# Altium schematic sheet PowerPanel_1_Mains_24V_48V.SchDoc
size 594 x 420 mm; SheetNumber: 2; SheetTotal: 6
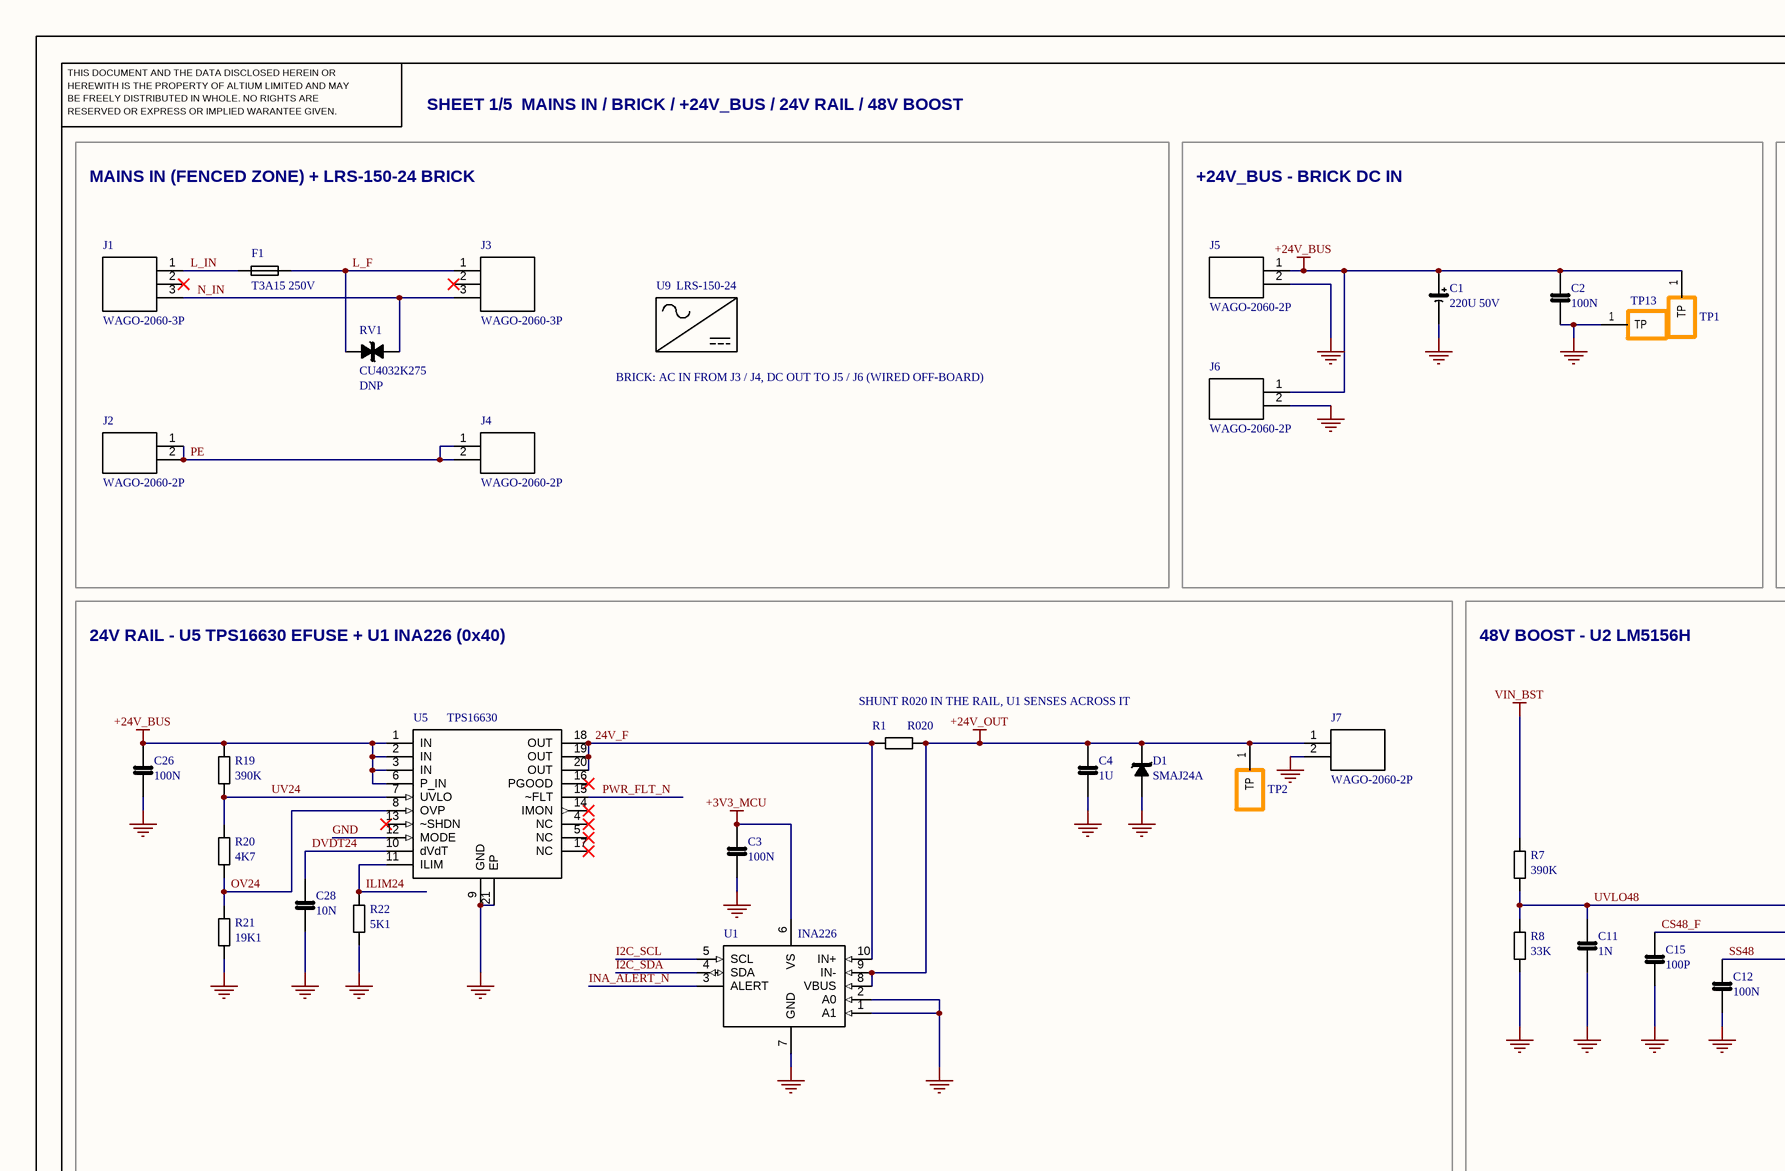
[diagram p0: PowerPanel_1_Mains_24V_48V.SchDoc, top left]
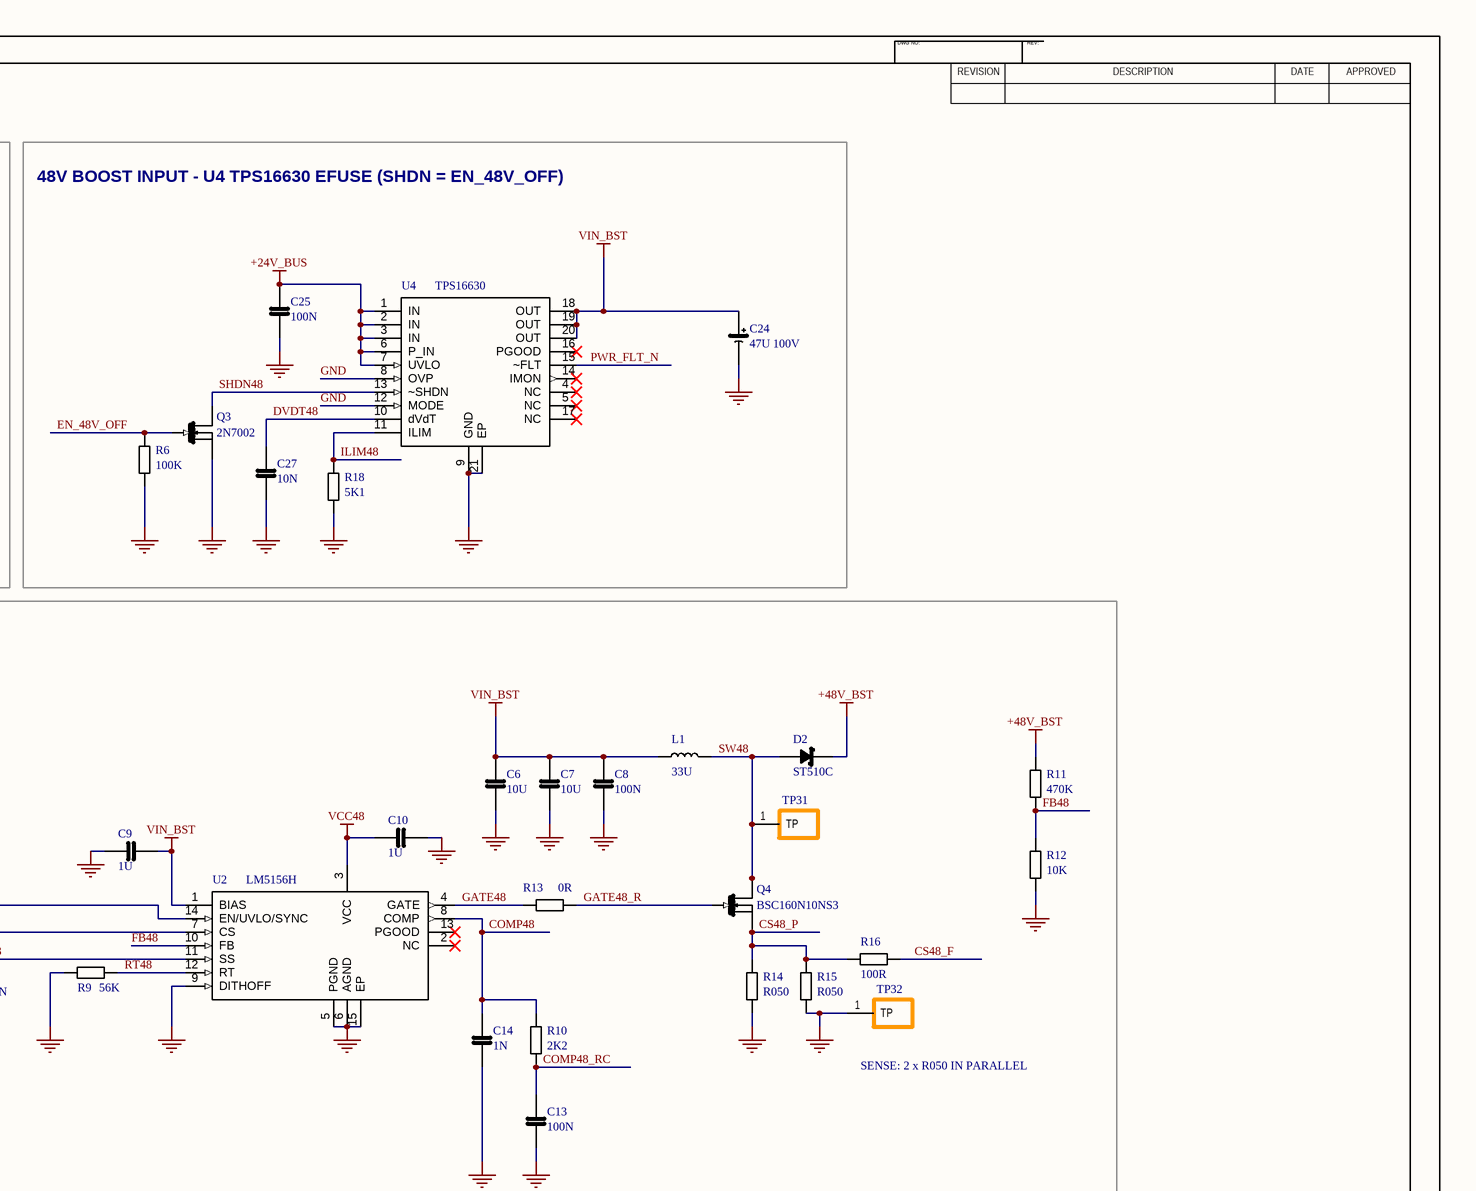
[diagram p1: PowerPanel_1_Mains_24V_48V.SchDoc, top right]
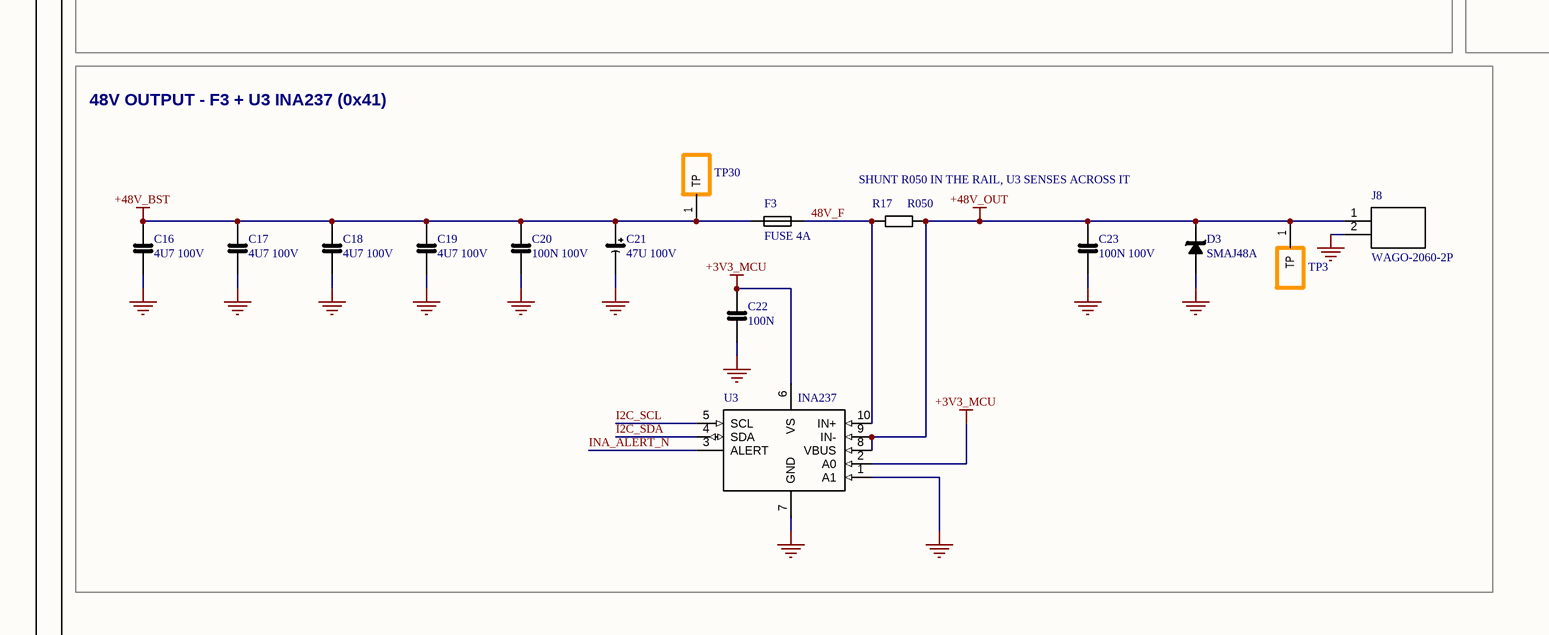
[diagram p2: PowerPanel_1_Mains_24V_48V.SchDoc, bottom left]
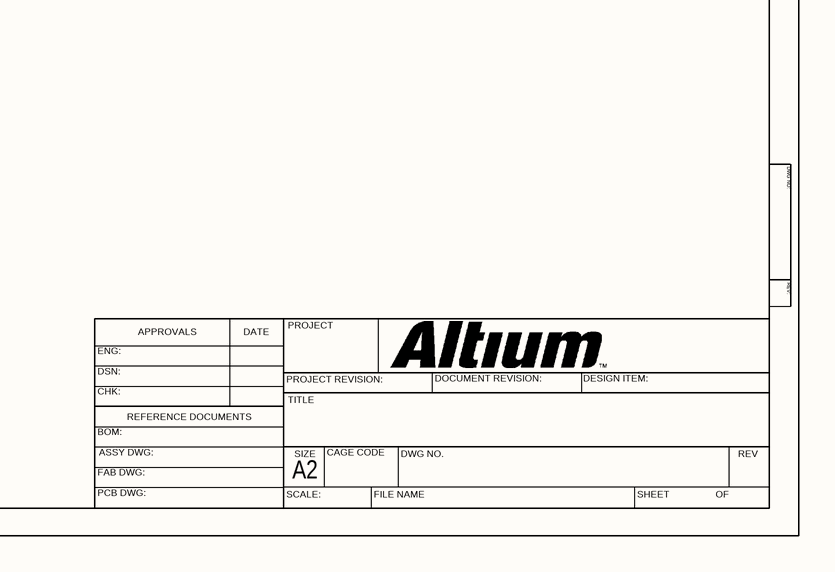
[diagram p3: PowerPanel_1_Mains_24V_48V.SchDoc, bottom right]

## Parts
C1  220U 50V  [CAPAE_D10X10.5]
C2  100N  [CAP0603]
C3  100N  [CAP0603]
C4  1U  [CAP0805]
C6  10U  [CAP1206]
C7  10U  [CAP1206]
C8  100N  [CAP0603]
C9  1U  [CAP0805]
C10  1U  [CAP0603]
C11  1N  [CAP0603]
C12  100N  [CAP0603]
C13  100N  [CAP0603]
C14  1N  [CAP0603]
C15  100P  [CAP0603]
C16  4U7 100V  [CAP1210]
C17  4U7 100V  [CAP1210]
C18  4U7 100V  [CAP1210]
C19  4U7 100V  [CAP1210]
C20  100N 100V  [CAP0603]
C21  47U 100V  [CAPAE_D8X10.5]
C22  100N  [CAP0603]
C23  100N 100V  [CAP0603]
C24  47U 100V  [CAPAE_D8X10.5]
C25  100N  [CAP0603]
C26  100N  [CAP0603]
C27  10N  [CAP0603]
C28  10N  [CAP0603]
D1  SMAJ24A  [SMA]
D2  ST510C  [SMC]
D3  SMAJ48A  [SMA]
F1  T3A15 250V  [FUSE_SCT1032]
F3  FUSE 4A  [FUSE1206]
J1  WAGO-2060-3P  [TERM_WAGO_2060-453]
J2  WAGO-2060-2P  [TERM_WAGO_2060-452]
J3  WAGO-2060-3P  [TERM_WAGO_2060-453]
J4  WAGO-2060-2P  [TERM_WAGO_2060-452]
J5  WAGO-2060-2P  [TERM_WAGO_2060-452]
J6  WAGO-2060-2P  [TERM_WAGO_2060-452]
J7  WAGO-2060-2P  [TERM_WAGO_2060-452]
J8  WAGO-2060-2P  [TERM_WAGO_2060-452]
L1  33U  [IND_MWSA1206S]
Q3  2N7002  [SOT-23-3]
Q4  BSC160N10NS3  [TDSON-8_5X6_EP]
R1  R020  [R1206]
R6  100K  [R0603]
R7  390K  [R0603]
R8  33K  [R0603]
R9  56K  [R0603]
R10  2K2  [R0603]
R11  470K  [R0603]
R12  10K  [R0603]
R13  0R  [R0603]
R14  R050  [R1206]
R15  R050  [R1206]
R16  100R  [R0603]
R17  R050  [R1206]
R18  5K1  [R0603]
R19  390K  [R0603]
R20  4K7  [R0603]
R21  19K1  [R0603]
R22  5K1  [R0603]
RV1  CU4032K275  [VAR_CU4032]
TP1  TP  [TESTPOINT]  (value not drawn)
TP2  TP  [TESTPOINT]  (value not drawn)
TP3  TP  [TESTPOINT]  (value not drawn)
TP13  TP  [TESTPOINT]  (value not drawn)
TP30  TP  [TESTPOINT]  (value not drawn)
TP31  TP  [TESTPOINT]  (value not drawn)
TP32  TP  [TESTPOINT]  (value not drawn)
U1  INA226  [MSOP-10]
U2  LM5156H  [HTSSOP-14_5X4.4_EP]
U3  INA237  [MSOP-10]
U4  TPS16630  [HTSSOP-20_6.5X4.4_EP]
U5  TPS16630  [HTSSOP-20_6.5X4.4_EP]
U9  LRS-150-24  [PSU_MW-LRS-150_CASE241A]

## Blocks framed on the sheet
MAINS IN (FENCED ZONE) + LRS-150-24 BRICK: F1 J1-J4 RV1 U9
+24V_BUS - BRICK DC IN: C1 C2 J5 J6 TP1 TP13
48V BOOST INPUT - U4 TPS16630 EFUSE (SHDN = EN_48V_OFF): C24 C25 C27 Q3 R6 R18 U4
24V RAIL - U5 TPS16630 EFUSE + U1 INA226 (0x40): C3 C4 C26 C28 D1 J7 R1 R19-R22 TP2 U1 U5
48V BOOST - U2 LM5156H: C6-C15 D2 L1 Q4 R7-R16 TP31 TP32 U2
48V OUTPUT - F3 + U3 INA237 (0x41): C16-C23 D3 F3 J8 R17 TP3 TP30 U3

## Nets
+3V3_MCU: C3.1 C22.1 U1.6(VS) U3.2(A0) U3.6(VS)
+24V_BUS: C1.1(+) C2.1 C25.1 C26.1 J5.1 J6.1 R19.1 TP1.1(TP) U4.1(IN) U4.2(IN) U4.3(IN) U4.6(P_IN) U4.7(UVLO) U5.1(IN) U5.2(IN) U5.3(IN) U5.6(P_IN)
+24V_OUT: C4.1 D1.1(K) J7.1 R1.2 TP2.1(TP) U1.8(VBUS) U1.9(IN-)
+48V_BST: C16.1 C17.1 C18.1 C19.1 C20.1 C21.1(+) D2.1(K) F3.1 R11.1 TP30.1(TP)
+48V_OUT: C23.1 D3.1(K) J8.1 R17.2 TP3.1(TP) U3.8(VBUS) U3.9(IN-)
GND: C1.2(-) C2.2 C3.2 C4.2 C6.2 C7.2 C8.2 C9.2 C10.2 C11.2 C12.2 C13.2 C14.2 C15.2 C16.2 C17.2 C18.2 C19.2 C20.2 C21.2(-) C22.2 C23.2 C24.2(-) C25.2 C26.2 C27.2 C28.2 D1.2(A) D3.2(A) J5.2 J6.2 J7.2 J8.2 Q3.2(S) R6.2 R8.2 R9.2 R12.2 R14.2 R15.2 R18.2 R21.2 R22.2 TP13.1(TP) TP32.1(TP) U1.1(A1) U1.2(A0) U1.7(GND) U2.5(PGND) U2.6(AGND) U2.9(DITHOFF) U2.15(EP) U3.1(A1) U3.7(GND) U4.8(OVP) U4.9(GND) U4.12(MODE) U4.21(EP) U5.9(GND) U5.12(MODE) U5.21(EP)
VCC48: C10.1 U2.3(VCC)
VIN_BST: C6.1 C7.1 C8.1 C9.1 C24.1(+) L1.1 R7.1 U2.1(BIAS) U4.18(OUT) U4.19(OUT) U4.20(OUT)
24V_F: R1.1 U1.10(IN+) U5.18(OUT) U5.19(OUT) U5.20(OUT)
48V_F: F3.2 R17.1 U3.10(IN+)
COMP48: C14.1 R10.1 U2.8(COMP)
COMP48_RC: C13.1 R10.2
CS48_F: C15.1 R16.2 U2.7(CS)
CS48_P: Q4.1(S) Q4.2(S) Q4.3(S) R14.1 R15.1 R16.1
DVDT24: C28.1 U5.10(dVdT)
DVDT48: C27.1 U4.10(dVdT)
EN_48V_OFF: Q3.1(G) R6.1
FB48: R11.2 R12.1 U2.10(FB)
GATE48: R13.1 U2.4(GATE)
GATE48_R: Q4.4(G) R13.2
I2C_SCL: U1.5(SCL) U3.5(SCL)
I2C_SDA: U1.4(SDA) U3.4(SDA)
ILIM24: R22.1 U5.11(ILIM)
ILIM48: R18.1 U4.11(ILIM)
INA_ALERT_N: U1.3(ALERT) U3.3(ALERT)
L_F: F1.2 J3.1 RV1.1
L_IN: F1.1 J1.1
N_IN: J1.3 J3.3 RV1.2
OV24: R20.2 R21.1 U5.8(OVP)
PE: J2.1 J2.2 J4.1 J4.2
PWR_FLT_N: U4.15(~FLT) U5.15(~FLT)
RT48: R9.1 U2.12(RT)
SHDN48: Q3.3(D) U4.13(~SHDN)
SS48: C12.1 U2.11(SS)
SW48: D2.2(A) L1.2 Q4.5(D) Q4.6(D) Q4.7(D) Q4.8(D) Q4.9(D) TP31.1(TP)
UV24: R19.2 R20.1 U5.7(UVLO)
UVLO48: C11.1 R7.2 R8.1 U2.14(EN/UVLO/SYNC)

Not connected (* = marked no-connect by the designer): J1 2*; J3 2*; U2 2(NC)* 13(PGOOD)*; U4 4(NC)* 5(NC)* 14(IMON)* 16(PGOOD)* 17(NC)*; U5 4(NC)* 5(NC)* 13(~SHDN)* 14(IMON)* 16(PGOOD)* 17(NC)*

## Notes on the sheet
- DWG NO:
- REV:
- THIS DOCUMENT AND THE DATA DISCLOSED HEREIN OR
- HEREWITH IS THE PROPERTY OF ALTIUM LIMITED AND MAY
- BE FREELY DISTRIBUTED IN WHOLE. NO RIGHTS ARE
- RESERVED OR EXPRESS OR IMPLIED WARANTEE GIVEN.
- SHEET 1/5  MAINS IN / BRICK / +24V_BUS / 24V RAIL / 48V BOOST
- REVISION
- DESCRIPTION
- DATE
- APPROVED
- (near U9) BRICK: AC IN FROM J3 / J4, DC OUT TO J5 / J6 (WIRED OFF-BOARD)
- (near R1) SHUNT R020 IN THE RAIL, U1 SENSES ACROSS IT
- (near TP32) SENSE: 2 x R050 IN PARALLEL
- (near R17) SHUNT R050 IN THE RAIL, U3 SENSES ACROSS IT
- ENG:
- APPROVALS
- PROJECT
- DSN:
- CHK:
- REFERENCE DOCUMENTS
- PROJECT REVISION:
- TITLE
- DOCUMENT REVISION:
- DESIGN ITEM:
- BOM:
- FAB DWG:
- PCB DWG:
- ASSY DWG:
- SCALE:
- A2
- SIZE
- CAGE CODE
- FILE NAME
- DWG NO.
- SHEET
- OF
- REV

## Library data of the parts
C1 = CP_220U_50V_10X10: CAP ALU // 220U // 50V // 20% // 105C // SMD D10X10.5; MFR: jieerrui; MPN: JVJ50V220M10x10; Value: 220U; LCSC: C46550417; JLC_TYPE: EXTENDED; JLC_CHECKED: 2026-10-03 STOCK 197742; Datasheet: https://www.lcsc.com/datasheet/lcsc_datasheet_2504101957_jieerrui-JVJ16V470M6x8_C46550400.pdf
C2 C3 C8 C12 C13 C22 C25 C26 = C_100N_0603: CAP // 100N // 50V // X7R // 0603; MFR: YAGEO; MPN: CC0603KRX7R9BB104; Value: 100N; LCSC: C14663; JLC_TYPE: BASIC; JLC_CHECKED: 2026-09-29 STOCK 55887132; Datasheet: https://www.lcsc.com/datasheet/lcsc_datasheet_2211101700_YAGEO-CC0603KRX7R9BB104_C14663.pdf
C4 C9 = C_1U_0805: CAP // 1U // 50V // X7R // 0805; MFR: Samsung Electro-Mechanics; MPN: CL21B105KBFNNNE; Value: 1U; LCSC: C28323; JLC_TYPE: BASIC; JLC_CHECKED: 2026-09-29 STOCK 2359989; Datasheet: https://www.lcsc.com/datasheet/lcsc_datasheet_2304140030_Samsung-Electro-Mechanics-CL21B105KBFNNNE_C28323.pdf
C6 C7 = C_10U_1206: CAP // 10U // 50V // X5R // 1206; MFR: Samsung Electro-Mechanics; MPN: CL31A106KBHNNNE; Value: 10U; LCSC: C13585; JLC_TYPE: BASIC; JLC_CHECKED: 2026-09-29 STOCK 2442079; Datasheet: https://www.lcsc.com/datasheet/lcsc_datasheet_2304140030_Samsung-Electro-Mechanics-CL31A106KBHNNNE_C13585.pdf
C10 = C_1U_0603: CAP // 1U // 50V // X5R // 0603; MFR: Samsung Electro-Mechanics; MPN: CL10A105KB8NNNC; Value: 1U; LCSC: C15849; JLC_TYPE: BASIC; JLC_CHECKED: 2026-09-29 STOCK 6435528; Datasheet: https://www.lcsc.com/datasheet/lcsc_datasheet_2304140030_Samsung-Electro-Mechanics-CL10A105KB8NNNC_C15849.pdf
C11 C14 = C_1N_0603: CAP // 1N // 50V // X7R // 0603; MFR: Samsung Electro-Mechanics; MPN: CL10B102KB8NNNC; Value: 1N; LCSC: C1588; JLC_TYPE: BASIC; JLC_CHECKED: 2026-09-29 STOCK 7937326; Datasheet: https://www.lcsc.com/datasheet/lcsc_datasheet_2304140030_Samsung-Electro-Mechanics-CL10B102KB8NNNC_C1588.pdf
C15 = C_100P_0603: CAP // 100P // 50V // C0G // 0603; MFR: Samsung Electro-Mechanics; MPN: CL10C101JB8NNNC; Value: 100P; LCSC: C14858; JLC_TYPE: BASIC; JLC_CHECKED: 2026-09-29 STOCK 4024635; Datasheet: https://www.lcsc.com/datasheet/lcsc_datasheet_2304140030_Samsung-Electro-Mechanics-CL10C101JB8NNNC_C14858.pdf
C16-C19 = C_4U7_100V_1210: CAP // 4U7 // 100V // X7R // 1210; MFR: PSA(Prosperity Dielectrics); MPN: FS32X475K101EGG; Value: 4U7; LCSC: C381466; JLC_TYPE: EXTENDED; JLC_CHECKED: 2026-10-03 STOCK 171506; Datasheet: https://wmsc.lcsc.com/wmsc/upload/file/pdf/v2/lcsc/2304140030_PSA-Prosperity-Dielectrics-FS32X475K101EGG_C381466.pdf
C20 C23 = C_100N_100V_0603: CAP // 100N // 100V // X7R // 0603; MFR: Samsung Electro-Mechanics; MPN: CL10B104KC8NNNC; Value: 100N; LCSC: C15725; JLC_TYPE: EXTENDED; JLC_CHECKED: 2026-10-03 STOCK 692214; Datasheet: https://www.lcsc.com/datasheet/lcsc_datasheet_2304140030_Samsung-Electro-Mechanics-CL10B104KC8NNNC_C15725.pdf
C21 C24 = CP_47U_100V_8X10: CAP ALU // 47U // 100V // 20% // 105C // SMD D8X10.5; MFR: jieerrui; MPN: RV100V47M8X10; Value: 47U; LCSC: C48935391; JLC_TYPE: EXTENDED; JLC_CHECKED: 2026-10-03 STOCK 115676; Datasheet: https://www.lcsc.com/datasheet/lcsc_datasheet_2505151725_jieerrui-RV100V47M8X10_C48935391.pdf
C27 C28 = C_10N_0603: CAP // 10N // 50V // X7R // 0603; MFR: FH (Guangdong Fenghua Advanced Tech); MPN: 0603B103K500NT; Value: 10N; LCSC: C57112; JLC_TYPE: BASIC; JLC_CHECKED: 2026-09-29 STOCK 6903861; Datasheet: https://www.lcsc.com/datasheet/lcsc_datasheet_2304140030_FH--Guangdong-Fenghua-Advanced-Tech-0603B103K500NT_C57112.pdf
D1 = D_SMAJ24A: TVS // 24V UNI // 400W // 38V9 CLAMP // SMA; MFR: hongjiacheng; Value: 24V; MPN: SMAJ24A; LCSC: C19077541; JLC_TYPE: PREFERRED; JLC_CHECKED: 2026-09-29 STOCK 132041; Datasheet: https://wmsc.lcsc.com/wmsc/upload/file/pdf/v2/lcsc/2312280937_hongjiacheng-SMAJ24A_C19077541.pdf
D2 = D_ST510C: SCHOTTKY // 100V 5A // 600MV // 150A IFSM // SMC; MFR: MDD (Microdiode Semiconductor); Value: 100V 5A; MPN: ST510C; LCSC: C414013; JLC_TYPE: EXTENDED; JLC_CHECKED: 2026-10-03 STOCK 2060; Datasheet: https://www.lcsc.com/datasheet/lcsc_datasheet_2408090958_MDD-Microdiode-Semiconductor-ST510C_C414013.pdf
D3 = D_SMAJ48A: TVS // 48V UNI // 400W // 77V4 CLAMP // SMA; MFR: Littelfuse; Value: 48V; MPN: SMAJ48A; LCSC: C223991; JLC_TYPE: EXTENDED; JLC_CHECKED: 2026-10-03 STOCK 5668; Datasheet: https://www.lcsc.com/datasheet/lcsc_datasheet_2304140030_Littelfuse-SMAJ48A_C223991.pdf
F1 = F_T3A15_250V_1032: FUSE // T3.15A TIME-LAG // 250VAC // 100A BREAK // SMD 10.3X3.3; MFR: SETsafe / SETfuse; MPN: SCT1032T3.15A250V; Value: 3A15; LCSC: C19712564; JLC_TYPE: EXTENDED; JLC_CHECKED: 2026-10-03 STOCK 1944; Datasheet: https://wmsc.lcsc.com/wmsc/upload/file/pdf/v2/lcsc/2312181522_SETsafe--/--SETfuse-SCT1032T3-15A250V_C19712564.pdf
F3 = F_4A_63V_1206: FUSE // 4A // FAST // 63V // 50A BREAK // 1206; MFR: Shenzhen JDT Fuse; MPN: JFC1206-1400FS; Value: 4A; LCSC: C136349; JLC_TYPE: EXTENDED; JLC_CHECKED: 2026-10-03 STOCK 45560; Datasheet: https://www.lcsc.com/datasheet/lcsc_datasheet_2305151206_Shenzhen-JDT-Fuse-JFC1206-1400FS_C136349.pdf
J1 J3 = J_TERM-SPRING_3P_4.0_SMD: CONN // WAGO 2060 PUSH-IN // 3P // 4.0MM // 9A 320V // SMD; MPN: 2060-453/998-404; Value: 3P; MFR: WAGO; LCSC: C2765056; JLC_TYPE: EXTENDED; JLC_CHECKED: 2026-10-03 STOCK 1543; Datasheet: https://wmsc.lcsc.com/wmsc/upload/file/pdf/v2/lcsc/2106061734_WAGO-2060-453-998-404_C2765056.pdf
J2 J4-J8 = J_TERM-SPRING_2P_4.0_SMD: CONN // WAGO 2060 PUSH-IN // 2P // 4.0MM // 9A 320V // SMD; MPN: 2060-452/998-404; Value: 2P; MFR: WAGO; LCSC: C2765055; JLC_TYPE: EXTENDED; JLC_CHECKED: 2026-10-03 STOCK 27983; Datasheet: https://wmsc.lcsc.com/wmsc/upload/file/pdf/v2/lcsc/2410121253_WAGO-2060-452-998-404_C2765055.pdf
L1 = L_33U_1350: IND // 33U // ISAT 4.8A // IRMS 4.8A // 75MR // 1350 MOLDED; MFR: Sunlord; MPN: MWSA1206S-330MT; Value: 33U; LCSC: C408530; JLC_TYPE: EXTENDED; JLC_CHECKED: 2026-10-03 STOCK 2989; Datasheet: https://media.digikey.com/pdf/Data%20Sheets/Shenzhen%20Sunlord/MWSA-S_Series_DS.pdf
Q3 = Q_2N7002: NMOS // 60V // 115MA // 5R@10V // SOT-23; MFR: Jiangsu Changjing Electronics Technology Co., Ltd.; Value: 2N7002; MPN: 2N7002; LCSC: C8545; JLC_TYPE: BASIC; JLC_CHECKED: 2026-09-29 STOCK 1679919; Datasheet: https://www.lcsc.com/datasheet/lcsc_datasheet_2304140030_Jiangsu-Changjing-Electronics-Technology-Co---Ltd--2N7002_C8545.pdf
Q4 = Q_BSC160N10NS3G: NMOS // 100V // 42A // 16MR@10V // TDSON-8 5X6; MFR: Infineon Technologies; Value: BSC160N10NS3G; MPN: BSC160N10NS3 G; LCSC: C148261; JLC_TYPE: EXTENDED; JLC_CHECKED: 2026-10-03 STOCK 3614; Datasheet: https://www.lcsc.com/datasheet/lcsc_datasheet_2304140030_Infineon-Technologies-BSC160N10NS3G_C148261.pdf
R1 = R_R020_1206: SHUNT // R020 // 1% // 1W // 70PPM // 1206; MFR: PSA(Prosperity Dielectrics); MPN: FMF06FTHR020-LH; Value: R020; LCSC: C371097; JLC_TYPE: EXTENDED; JLC_CHECKED: 2026-10-03 STOCK 16724; Datasheet: https://www.lcsc.com/datasheet/lcsc_datasheet_2304140030_PSA-Prosperity-Dielectrics-FMF06FTHR020-LH_C371097.pdf
R6 = R_100K_0603: RES // 100K // 1% // 100MW // 0603; MFR: UNI-ROYAL(Uniroyal Elec); MPN: 0603WAF1003T5E; Value: 100K; LCSC: C25803; JLC_TYPE: BASIC; JLC_CHECKED: 2026-09-29 STOCK 22429301; Datasheet: https://www.lcsc.com/datasheet/lcsc_datasheet_2206010045_UNI-ROYAL-Uniroyal-Elec-0603WAF1003T5E_C25803.pdf
R7 R19 = R_390K_0603: RES // 390K // 1% // 100MW // 0603; MFR: UNI-ROYAL(Uniroyal Elec); MPN: 0603WAF3903T5E; Value: 390K; LCSC: C23150; JLC_TYPE: PREFERRED; JLC_CHECKED: 2026-10-03 STOCK 76545; Datasheet: https://www.lcsc.com/datasheet/lcsc_datasheet_2206010116_UNI-ROYAL-Uniroyal-Elec-0603WAF3903T5E_C23150.pdf
R8 = R_33K_0603: RES // 33K // 1% // 100MW // 0603; MFR: UNI-ROYAL(Uniroyal Elec); MPN: 0603WAF3302T5E; Value: 33K; LCSC: C4216; JLC_TYPE: BASIC; JLC_CHECKED: 2026-10-03 STOCK 3235651; Datasheet: https://www.lcsc.com/datasheet/lcsc_datasheet_2206010230_UNI-ROYAL-Uniroyal-Elec-0603WAF3302T5E_C4216.pdf
R9 = R_56K_0603: RES // 56K // 1% // 100MW // 0603; MFR: UNI-ROYAL(Uniroyal Elec); MPN: 0603WAF5602T5E; Value: 56K; LCSC: C23206; JLC_TYPE: BASIC; JLC_CHECKED: 2026-10-03 STOCK 1024608; Datasheet: https://www.lcsc.com/datasheet/lcsc_datasheet_2206010116_UNI-ROYAL-Uniroyal-Elec-0603WAF5602T5E_C23206.pdf
R10 = R_2K2_0603: RES // 2K2 // 1% // 100MW // 0603; MFR: UNI-ROYAL(Uniroyal Elec); MPN: 0603WAF2201T5E; Value: 2K2; LCSC: C4190; JLC_TYPE: BASIC; JLC_CHECKED: 2026-09-29 STOCK 7718232; Datasheet: https://www.lcsc.com/datasheet/lcsc_datasheet_2206010230_UNI-ROYAL-Uniroyal-Elec-0603WAF2201T5E_C4190.pdf
R11 = R_470K_0603: RES // 470K // 1% // 100MW // 0603; MFR: UNI-ROYAL(Uniroyal Elec); MPN: 0603WAF4703T5E; Value: 470K; LCSC: C23178; JLC_TYPE: BASIC; JLC_CHECKED: 2026-10-03 STOCK 1456053; Datasheet: https://www.lcsc.com/datasheet/lcsc_datasheet_2206010116_UNI-ROYAL-Uniroyal-Elec-0603WAF4703T5E_C23178.pdf
R12 = R_10K_0603: RES // 10K // 1% // 100MW // 0603; MFR: UNI-ROYAL(Uniroyal Elec); MPN: 0603WAF1002T5E; Value: 10K; LCSC: C25804; JLC_TYPE: BASIC; JLC_CHECKED: 2026-09-29 STOCK 21309815; Datasheet: https://www.lcsc.com/datasheet/lcsc_datasheet_2206010045_UNI-ROYAL-Uniroyal-Elec-0603WAF1002T5E_C25804.pdf
R13 = R_0R_0603: RES // 0R // JUMPER // 0603; MFR: UNI-ROYAL(Uniroyal Elec); MPN: 0603WAF0000T5E; Value: 0R; LCSC: C21189; JLC_TYPE: BASIC; JLC_CHECKED: 2026-09-29 STOCK 24079380; Datasheet: https://www.lcsc.com/datasheet/lcsc_datasheet_2411221126_UNI-ROYAL-Uniroyal-Elec-0603WAF0000T5E_C21189.pdf
R14 R15 R17 = R_R050_1206: SHUNT // R050 // 1% // 1W // 1206; MFR: Shenzhen Yezhan Elec.; MPN: YLRY06-1-50F; Value: R050; LCSC: C20608719; JLC_TYPE: EXTENDED; JLC_CHECKED: 2026-09-29 STOCK 79173; Datasheet: https://wmsc.lcsc.com/wmsc/upload/file/pdf/v2/lcsc/2401171159_Shenzhen-Yezhan-Elec--YLRY06-1-50F_C20608719.pdf
R16 = R_100R_0603: RES // 100R // 1% // 100MW // 0603; MFR: UNI-ROYAL(Uniroyal Elec); MPN: 0603WAF1000T5E; Value: 100R; LCSC: C22775; JLC_TYPE: BASIC; JLC_CHECKED: 2026-09-29 STOCK 11791812; Datasheet: https://www.lcsc.com/datasheet/lcsc_datasheet_2411221126_UNI-ROYAL-Uniroyal-Elec-0603WAF1000T5E_C22775.pdf
R18 R22 = R_5K1_0603: RES // 5K1 // 1% // 100MW // 0603; MFR: UNI-ROYAL(Uniroyal Elec); MPN: 0603WAF5101T5E; Value: 5K1; LCSC: C23186; JLC_TYPE: BASIC; JLC_CHECKED: 2026-09-29 STOCK 25577365; Datasheet: https://www.lcsc.com/datasheet/lcsc_datasheet_2206010116_UNI-ROYAL-Uniroyal-Elec-0603WAF5101T5E_C23186.pdf
R20 = R_4K7_0603: RES // 4K7 // 1% // 100MW // 0603; MFR: UNI-ROYAL(Uniroyal Elec); MPN: 0603WAF4701T5E; Value: 4K7; LCSC: C23162; JLC_TYPE: BASIC; JLC_CHECKED: 2026-09-29 STOCK 22752027; Datasheet: https://www.lcsc.com/datasheet/lcsc_datasheet_2206010116_UNI-ROYAL-Uniroyal-Elec-0603WAF4701T5E_C23162.pdf
R21 = R_19K1_0603: RES // 19K1 // 1% // 100MW // 0603; MFR: UNI-ROYAL(Uniroyal Elec); MPN: 0603WAF1912T5E; Value: 19K1; LCSC: C22897; JLC_TYPE: EXTENDED; JLC_CHECKED: 2026-10-03 STOCK 64956; Datasheet: https://www.lcsc.com/datasheet/lcsc_datasheet_2206010130_UNI-ROYAL-Uniroyal-Elec-0603WAF1912T5E_C22897.pdf
RV1 = RV_275VAC_SMD10X8: VARISTOR // 430V // 275VAC 350VDC // 1K2A // 710V CLAMP // SMD 10.2X8; MFR: TDK; MPN: B72660M0271K072; Value: 430V; LCSC: C211138; JLC_TYPE: EXTENDED; JLC_CHECKED: 2026-10-03 STOCK 955; Datasheet: https://wmsc.lcsc.com/wmsc/upload/file/pdf/v2/lcsc/2406141752_TDK-B72660M0271K072_C211138.pdf; DNP: DNP
TP1-TP3 TP13 TP30-TP32 = TP: TP // SMD PAD // 1.5MM; MPN: TEST POINT (NOT A BOM PART)
U1 = U_INA226: PWR MON // 36V // 16BIT I2C // ALERT // VSSOP-10; MFR: Texas Instruments; MPN: INA226AIDGSR; Value: INA226; LCSC: C49851; JLC_TYPE: EXTENDED; JLC_CHECKED: 2026-09-29 STOCK 48191; Datasheet: https://www.lcsc.com/datasheet/lcsc_datasheet_2312041157_Texas-Instruments-INA226AIDGSR_C49851.pdf
U2 = U_LM5156H: BOOST CTRL // 2V97-60V // 100K-2M2HZ // NON-HICCUP // HTSSOP-14; MFR: Texas Instruments; MPN: LM5156HPWPR; Value: LM5156H; LCSC: C2867852; JLC_TYPE: EXTENDED; JLC_CHECKED: 2026-10-03 STOCK 3172; Datasheet: https://www.ti.com/lit/ds/symlink/lm5156h.pdf
U3 = U_INA237: PWR MON // 85V // 16BIT I2C // ALERT // VSSOP-10; MFR: Texas Instruments; MPN: INA237AIDGSR; Value: INA237; LCSC: C2864837; JLC_TYPE: EXTENDED; JLC_CHECKED: 2026-10-03 STOCK 5235; Datasheet: https://www.ti.com/lit/ds/symlink/ina237.pdf
U4 U5 = U_TPS16630PWP: EFUSE // 4V5-60V // 6A // 31MR // UVLO OVP // HTSSOP-20; MFR: Texas Instruments; MPN: TPS16630PWPR; Value: TPS16630; LCSC: C1849461; JLC_TYPE: EXTENDED; JLC_CHECKED: 2026-10-03 STOCK 1141; Datasheet: https://www.ti.com/lit/ds/symlink/tps1663.pdf
U9 = PSU_LRS-150-24: PSU // AC-DC // 24V 6.5A // 150W // CASE 241A 159X97X30 // HAND FITTED; MFR: Mean Well; Value: 24V 150W; Assembly: HAND - BOUGHT SEPARATELY, SCREWED ON + WIRED AFTER PCBA (NOT JLC); BOM_Extra: KAPTON SHEET >=165X103X0.1MM UNDER THE BRICK + 2X M3X4 SCREWS (WAFER HEAD OR ISO 10642, A-HV5); MPN: LRS-150-24; Datasheet: https://www.meanwell.com/Upload/PDF/LRS-150/LRS-150-SPEC.PDF